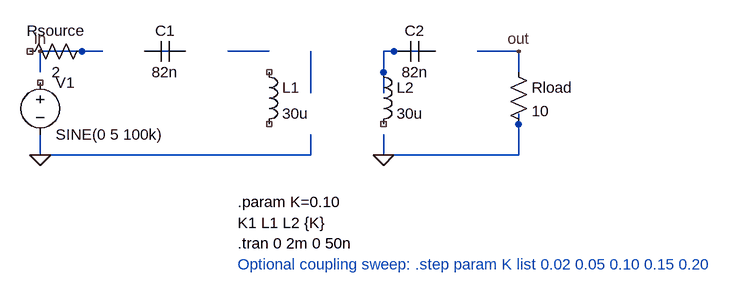
[diagram p0: schematic 01-resonant-link.asc]
01-resonant-link.asc, the LTspice schematic file:
Version 4
SHEET 1 1040 680
WIRE 96 96 96 128
WIRE 96 96 192 96
WIRE 256 96 320 96
WIRE 384 96 448 96
WIRE 512 96 512 160
WIRE 96 224 96 256
WIRE 96 256 512 256
WIRE 512 224 512 256
WIRE 624 96 624 160
WIRE 624 96 704 96
WIRE 768 96 832 96
WIRE 832 96 832 128
WIRE 624 224 624 256
WIRE 624 256 832 256
WIRE 832 192 832 256
FLAG 96 256 0
FLAG 624 256 0
FLAG 96 96 in
FLAG 832 96 out
SYMBOL voltage 96 128 R0
WINDOW 123 24 124 Left 2
WINDOW 39 0 0 Left 2
SYMATTR InstName V1
SYMATTR Value SINE(0 5 100k)
SYMBOL res 176 80 R90
WINDOW 0 0 56 VBottom 2
WINDOW 3 32 56 VTop 2
SYMATTR InstName Rsource
SYMATTR Value 2
SYMBOL cap 320 80 R90
WINDOW 0 0 32 VBottom 2
WINDOW 3 32 32 VTop 2
SYMATTR InstName C1
SYMATTR Value 82n
SYMBOL ind 432 112 R0
SYMATTR InstName L1
SYMATTR Value 30u
SYMATTR SpiceLine Rser=0.3
SYMBOL ind 608 112 R0
SYMATTR InstName L2
SYMATTR Value 30u
SYMATTR SpiceLine Rser=0.3
SYMBOL cap 704 80 R90
WINDOW 0 0 32 VBottom 2
WINDOW 3 32 32 VTop 2
SYMATTR InstName C2
SYMATTR Value 82n
SYMBOL res 816 112 R0
SYMATTR InstName Rload
SYMATTR Value 10
TEXT 400 328 Left 2 !.param K=0.10
TEXT 400 360 Left 2 !K1 L1 L2 {K}
TEXT 400 392 Left 2 !.tran 0 2m 0 50n
TEXT 400 424 Left 2 ;Optional coupling sweep: .step param K list 0.02 0.05 0.10 0.15 0.20

The netlist it stands for:
* 01-resonant-link.asc
V1 NC_01 0 SINE(0 5 100k)
Rsource in NC_02 2
C1 N001 N001 82n
L1 NC_03 NC_04 30u Rser=0.3
L2 N004 NC_05 30u Rser=0.3
C2 N004 N004 82n
Rload out 0 10
.param K=0.10
K1 L1 L2 {K}
.tran 0 2m 0 50n
* Optional coupling sweep: .step param K list 0.02 0.05 0.10 0.15 0.20
.backanno
.end